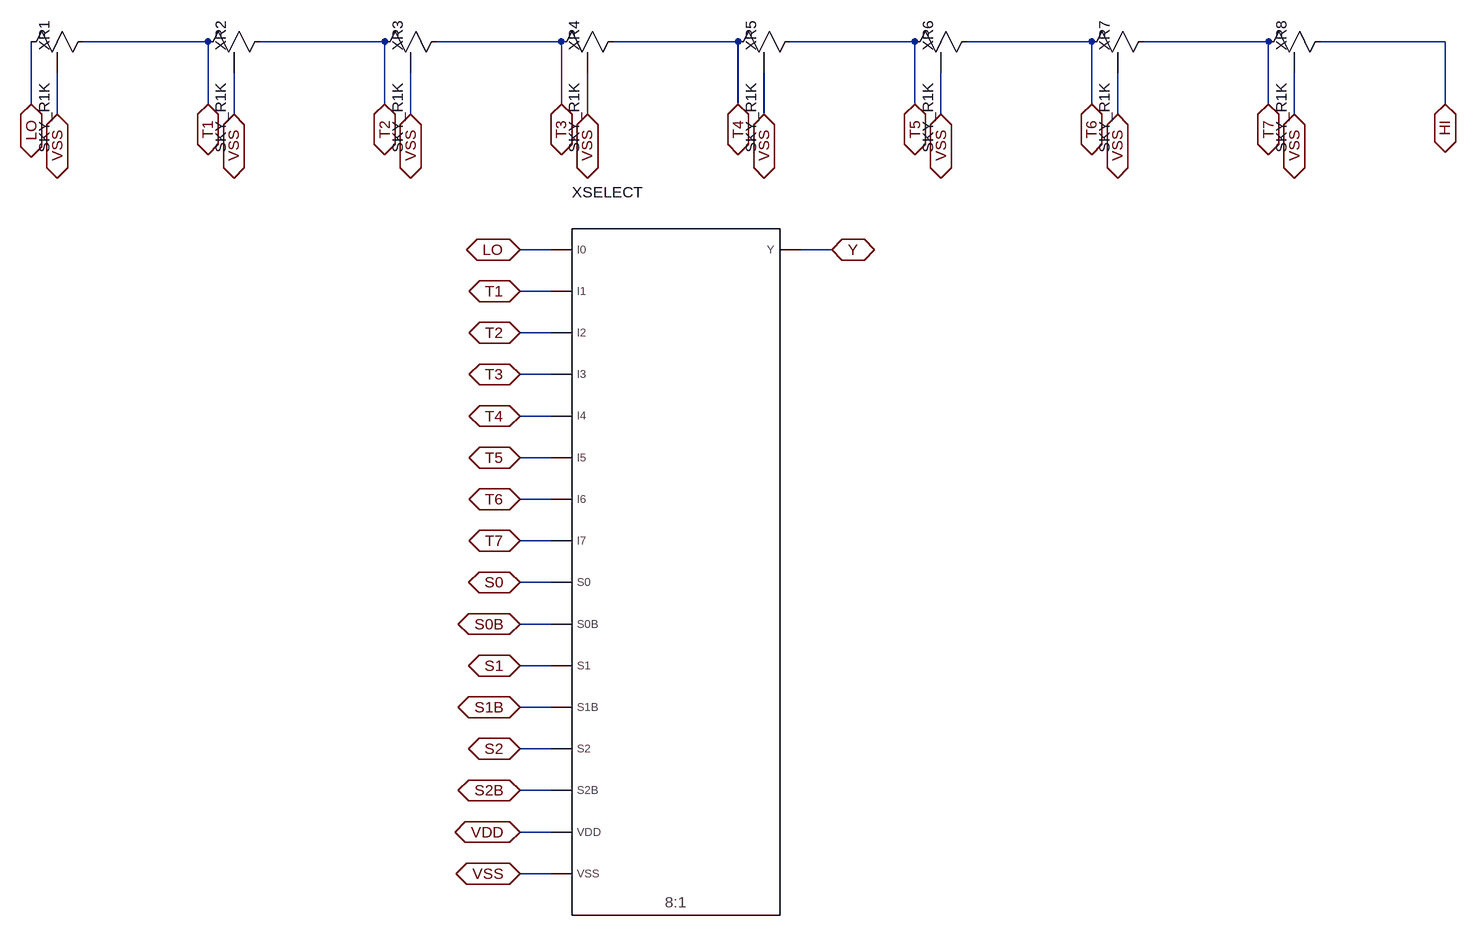
[diagram p0: schematic DAC_Bank8.asc]
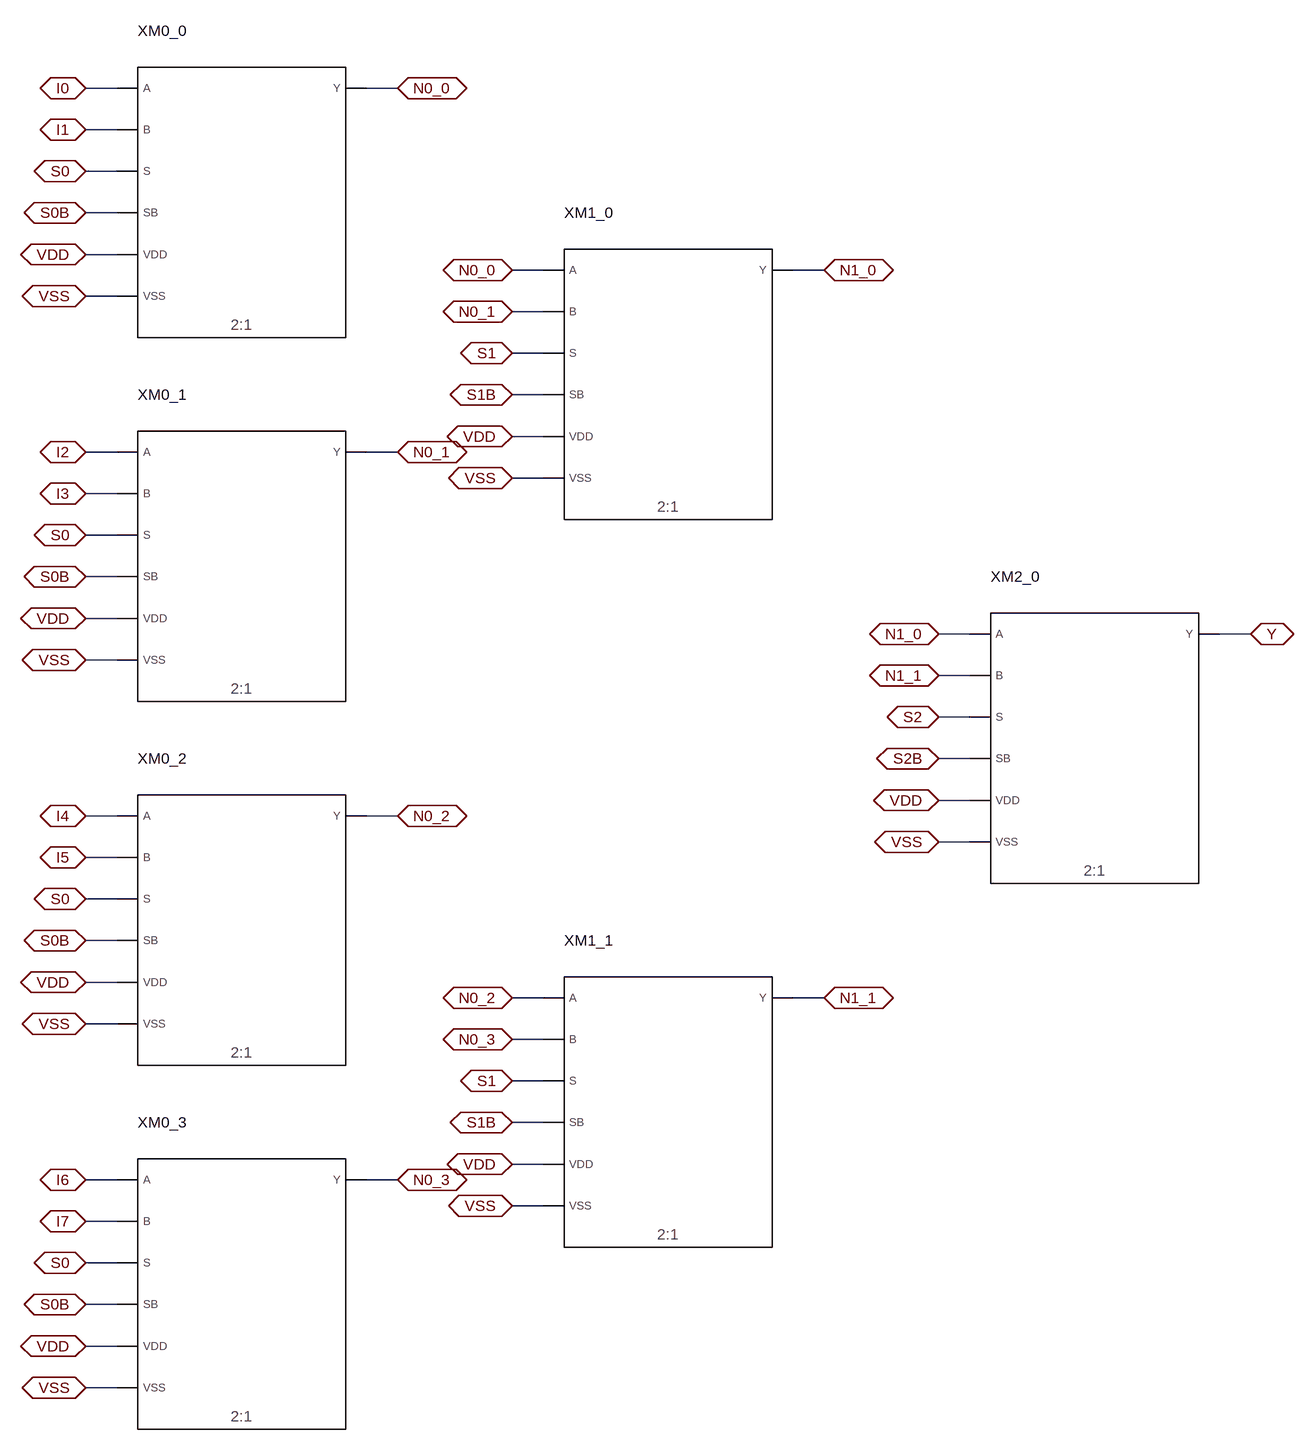
[diagram p1: sub-circuit dac_mux8.asc]
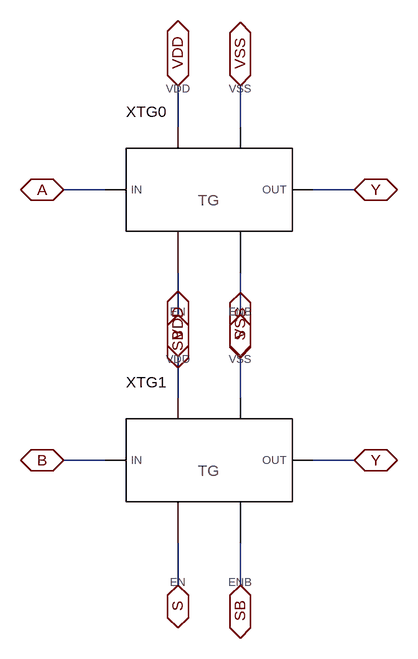
[diagram p2: sub-circuit dac_mux2.asc]
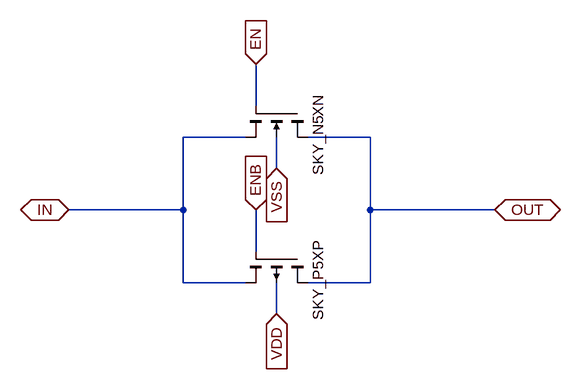
[diagram p3: sub-circuit cmos_tg.asc]
DAC_Bank8.asc, the LTspice schematic file:
Version 4.1
SHEET 1 2512 1664
WIRE 160 224 160 320
WIRE 240 224 432 224
WIRE 432 224 432 320
WIRE 512 224 704 224
WIRE 704 224 704 320
WIRE 784 224 976 224
WIRE 976 224 976 320
WIRE 1056 224 1248 224
WIRE 1248 224 1248 320
WIRE 1328 224 1520 224
WIRE 1520 224 1520 320
WIRE 1600 224 1792 224
WIRE 1792 224 1792 320
WIRE 1872 224 2064 224
WIRE 2064 224 2064 320
WIRE 2144 224 2336 224
WIRE 2336 224 2336 320
WIRE 960 544 912 544
WIRE 960 608 912 608
WIRE 960 672 912 672
WIRE 960 736 912 736
WIRE 960 800 912 800
WIRE 960 864 912 864
WIRE 960 928 912 928
WIRE 960 992 912 992
WIRE 960 1056 912 1056
WIRE 960 1120 912 1120
WIRE 960 1184 912 1184
WIRE 960 1248 912 1248
WIRE 960 1312 912 1312
WIRE 960 1376 912 1376
WIRE 960 1440 912 1440
WIRE 960 1504 912 1504
WIRE 1344 544 1392 544
WIRE 200 272 200 336
WIRE 472 272 472 336
WIRE 744 272 744 336
WIRE 1016 272 1016 336
WIRE 1288 272 1288 336
WIRE 1560 272 1560 336
WIRE 1832 272 1832 336
WIRE 2104 272 2104 336
FLAG 160 320 LO
IOPIN 160 320 BiDir
FLAG 432 320 T1
IOPIN 432 320 BiDir
FLAG 704 320 T2
IOPIN 704 320 BiDir
FLAG 976 320 T3
IOPIN 976 320 BiDir
FLAG 1248 320 T4
IOPIN 1248 320 BiDir
FLAG 1520 320 T5
IOPIN 1520 320 BiDir
FLAG 1792 320 T6
IOPIN 1792 320 BiDir
FLAG 2064 320 T7
IOPIN 2064 320 BiDir
FLAG 2336 320 HI
IOPIN 2336 320 BiDir
FLAG 912 544 LO
IOPIN 912 544 BiDir
FLAG 912 608 T1
IOPIN 912 608 BiDir
FLAG 912 672 T2
IOPIN 912 672 BiDir
FLAG 912 736 T3
IOPIN 912 736 BiDir
FLAG 912 800 T4
IOPIN 912 800 BiDir
FLAG 912 864 T5
IOPIN 912 864 BiDir
FLAG 912 928 T6
IOPIN 912 928 BiDir
FLAG 912 992 T7
IOPIN 912 992 BiDir
FLAG 912 1056 S0
IOPIN 912 1056 BiDir
FLAG 912 1120 S0B
IOPIN 912 1120 BiDir
FLAG 912 1184 S1
IOPIN 912 1184 BiDir
FLAG 912 1248 S1B
IOPIN 912 1248 BiDir
FLAG 912 1312 S2
IOPIN 912 1312 BiDir
FLAG 912 1376 S2B
IOPIN 912 1376 BiDir
FLAG 912 1440 VDD
IOPIN 912 1440 BiDir
FLAG 912 1504 VSS
IOPIN 912 1504 BiDir
FLAG 1392 544 Y
IOPIN 1392 544 BiDir
FLAG 200 336 VSS
IOPIN 200 336 BiDir
FLAG 472 336 VSS
IOPIN 472 336 BiDir
FLAG 744 336 VSS
IOPIN 744 336 BiDir
FLAG 1016 336 VSS
IOPIN 1016 336 BiDir
FLAG 1288 336 VSS
IOPIN 1288 336 BiDir
FLAG 1560 336 VSS
IOPIN 1560 336 BiDir
FLAG 1832 336 VSS
IOPIN 1832 336 BiDir
FLAG 2104 336 VSS
IOPIN 2104 336 BiDir
SYMBOL blocks\\Sky_R 256 208 R90
WINDOW 0 -16 76 Left 2
WINDOW 3 80 76 Left 2
SYMATTR InstName XR1
SYMATTR Value SKY_R1K
SYMATTR Prefix X
SYMBOL blocks\\Sky_R 528 208 R90
WINDOW 0 -16 76 Left 2
WINDOW 3 80 76 Left 2
SYMATTR InstName XR2
SYMATTR Value SKY_R1K
SYMATTR Prefix X
SYMBOL blocks\\Sky_R 800 208 R90
WINDOW 0 -16 76 Left 2
WINDOW 3 80 76 Left 2
SYMATTR InstName XR3
SYMATTR Value SKY_R1K
SYMATTR Prefix X
SYMBOL blocks\\Sky_R 1072 208 R90
WINDOW 0 -16 76 Left 2
WINDOW 3 80 76 Left 2
SYMATTR InstName XR4
SYMATTR Value SKY_R1K
SYMATTR Prefix X
SYMBOL blocks\\Sky_R 1344 208 R90
WINDOW 0 -16 76 Left 2
WINDOW 3 80 76 Left 2
SYMATTR InstName XR5
SYMATTR Value SKY_R1K
SYMATTR Prefix X
SYMBOL blocks\\Sky_R 1616 208 R90
WINDOW 0 -16 76 Left 2
WINDOW 3 80 76 Left 2
SYMATTR InstName XR6
SYMATTR Value SKY_R1K
SYMATTR Prefix X
SYMBOL blocks\\Sky_R 1888 208 R90
WINDOW 0 -16 76 Left 2
WINDOW 3 80 76 Left 2
SYMATTR InstName XR7
SYMATTR Value SKY_R1K
SYMATTR Prefix X
SYMBOL blocks\\Sky_R 2160 208 R90
WINDOW 0 -16 76 Left 2
WINDOW 3 80 76 Left 2
SYMATTR InstName XR8
SYMATTR Value SKY_R1K
SYMATTR Prefix X
SYMBOL blocks\\DAC_Mux8 960 480 R0
WINDOW 0 32 -24 Left 2
SYMATTR InstName XSELECT

dac_mux8.asc, the sub-circuit schematic file:
Version 4.1
SHEET 1 2112 2448
WIRE 192 160 144 160
WIRE 192 224 144 224
WIRE 192 288 144 288
WIRE 192 352 144 352
WIRE 192 416 144 416
WIRE 192 480 144 480
WIRE 576 160 624 160
WIRE 192 720 144 720
WIRE 192 784 144 784
WIRE 192 848 144 848
WIRE 192 912 144 912
WIRE 192 976 144 976
WIRE 192 1040 144 1040
WIRE 576 720 624 720
WIRE 192 1280 144 1280
WIRE 192 1344 144 1344
WIRE 192 1408 144 1408
WIRE 192 1472 144 1472
WIRE 192 1536 144 1536
WIRE 192 1600 144 1600
WIRE 576 1280 624 1280
WIRE 192 1840 144 1840
WIRE 192 1904 144 1904
WIRE 192 1968 144 1968
WIRE 192 2032 144 2032
WIRE 192 2096 144 2096
WIRE 192 2160 144 2160
WIRE 576 1840 624 1840
WIRE 848 440 800 440
WIRE 848 504 800 504
WIRE 848 568 800 568
WIRE 848 632 800 632
WIRE 848 696 800 696
WIRE 848 760 800 760
WIRE 1232 440 1280 440
WIRE 848 1560 800 1560
WIRE 848 1624 800 1624
WIRE 848 1688 800 1688
WIRE 848 1752 800 1752
WIRE 848 1816 800 1816
WIRE 848 1880 800 1880
WIRE 1232 1560 1280 1560
WIRE 1504 1000 1456 1000
WIRE 1504 1064 1456 1064
WIRE 1504 1128 1456 1128
WIRE 1504 1192 1456 1192
WIRE 1504 1256 1456 1256
WIRE 1504 1320 1456 1320
WIRE 1888 1000 1936 1000
FLAG 144 160 I0
IOPIN 144 160 BiDir
FLAG 144 224 I1
IOPIN 144 224 BiDir
FLAG 144 288 S0
IOPIN 144 288 BiDir
FLAG 144 352 S0B
IOPIN 144 352 BiDir
FLAG 144 416 VDD
IOPIN 144 416 BiDir
FLAG 144 480 VSS
IOPIN 144 480 BiDir
FLAG 624 160 N0_0
IOPIN 624 160 BiDir
FLAG 144 720 I2
IOPIN 144 720 BiDir
FLAG 144 784 I3
IOPIN 144 784 BiDir
FLAG 144 848 S0
IOPIN 144 848 BiDir
FLAG 144 912 S0B
IOPIN 144 912 BiDir
FLAG 144 976 VDD
IOPIN 144 976 BiDir
FLAG 144 1040 VSS
IOPIN 144 1040 BiDir
FLAG 624 720 N0_1
IOPIN 624 720 BiDir
FLAG 144 1280 I4
IOPIN 144 1280 BiDir
FLAG 144 1344 I5
IOPIN 144 1344 BiDir
FLAG 144 1408 S0
IOPIN 144 1408 BiDir
FLAG 144 1472 S0B
IOPIN 144 1472 BiDir
FLAG 144 1536 VDD
IOPIN 144 1536 BiDir
FLAG 144 1600 VSS
IOPIN 144 1600 BiDir
FLAG 624 1280 N0_2
IOPIN 624 1280 BiDir
FLAG 144 1840 I6
IOPIN 144 1840 BiDir
FLAG 144 1904 I7
IOPIN 144 1904 BiDir
FLAG 144 1968 S0
IOPIN 144 1968 BiDir
FLAG 144 2032 S0B
IOPIN 144 2032 BiDir
FLAG 144 2096 VDD
IOPIN 144 2096 BiDir
FLAG 144 2160 VSS
IOPIN 144 2160 BiDir
FLAG 624 1840 N0_3
IOPIN 624 1840 BiDir
FLAG 800 440 N0_0
IOPIN 800 440 BiDir
FLAG 800 504 N0_1
IOPIN 800 504 BiDir
FLAG 800 568 S1
IOPIN 800 568 BiDir
FLAG 800 632 S1B
IOPIN 800 632 BiDir
FLAG 800 696 VDD
IOPIN 800 696 BiDir
FLAG 800 760 VSS
IOPIN 800 760 BiDir
FLAG 1280 440 N1_0
IOPIN 1280 440 BiDir
FLAG 800 1560 N0_2
IOPIN 800 1560 BiDir
FLAG 800 1624 N0_3
IOPIN 800 1624 BiDir
FLAG 800 1688 S1
IOPIN 800 1688 BiDir
FLAG 800 1752 S1B
IOPIN 800 1752 BiDir
FLAG 800 1816 VDD
IOPIN 800 1816 BiDir
FLAG 800 1880 VSS
IOPIN 800 1880 BiDir
FLAG 1280 1560 N1_1
IOPIN 1280 1560 BiDir
FLAG 1456 1000 N1_0
IOPIN 1456 1000 BiDir
FLAG 1456 1064 N1_1
IOPIN 1456 1064 BiDir
FLAG 1456 1128 S2
IOPIN 1456 1128 BiDir
FLAG 1456 1192 S2B
IOPIN 1456 1192 BiDir
FLAG 1456 1256 VDD
IOPIN 1456 1256 BiDir
FLAG 1456 1320 VSS
IOPIN 1456 1320 BiDir
FLAG 1936 1000 Y
IOPIN 1936 1000 BiDir
SYMBOL blocks\\DAC_Mux2 192 96 R0
WINDOW 0 32 -24 Left 2
SYMATTR InstName XM0_0
SYMBOL blocks\\DAC_Mux2 192 656 R0
WINDOW 0 32 -24 Left 2
SYMATTR InstName XM0_1
SYMBOL blocks\\DAC_Mux2 192 1216 R0
WINDOW 0 32 -24 Left 2
SYMATTR InstName XM0_2
SYMBOL blocks\\DAC_Mux2 192 1776 R0
WINDOW 0 32 -24 Left 2
SYMATTR InstName XM0_3
SYMBOL blocks\\DAC_Mux2 848 376 R0
WINDOW 0 32 -24 Left 2
SYMATTR InstName XM1_0
SYMBOL blocks\\DAC_Mux2 848 1496 R0
WINDOW 0 32 -24 Left 2
SYMATTR InstName XM1_1
SYMBOL blocks\\DAC_Mux2 1504 936 R0
WINDOW 0 32 -24 Left 2
SYMATTR InstName XM2_0

dac_mux2.asc, the sub-circuit schematic file:
Version 4.1
SHEET 1 1344 1008
WIRE 352 224 288 224
WIRE 672 224 736 224
WIRE 464 128 464 64
WIRE 560 128 560 64
WIRE 464 352 464 416
WIRE 560 352 560 416
WIRE 352 640 288 640
WIRE 672 640 736 640
WIRE 464 544 464 480
WIRE 560 544 560 480
WIRE 464 768 464 832
WIRE 560 768 560 832
FLAG 288 224 A
IOPIN 288 224 BiDir
FLAG 736 224 Y
IOPIN 736 224 BiDir
FLAG 464 64 VDD
IOPIN 464 64 BiDir
FLAG 560 64 VSS
IOPIN 560 64 BiDir
FLAG 464 416 SB
IOPIN 464 416 BiDir
FLAG 560 416 S
IOPIN 560 416 BiDir
FLAG 288 640 B
IOPIN 288 640 BiDir
FLAG 736 640 Y
IOPIN 736 640 BiDir
FLAG 464 480 VDD
IOPIN 464 480 BiDir
FLAG 560 480 VSS
IOPIN 560 480 BiDir
FLAG 464 832 S
IOPIN 464 832 BiDir
FLAG 560 832 SB
IOPIN 560 832 BiDir
SYMBOL blocks\\CMOS_TG 352 128 R0
WINDOW 0 32 -24 Left 2
SYMATTR InstName XTG0
SYMBOL blocks\\CMOS_TG 352 544 R0
WINDOW 0 32 -24 Left 2
SYMATTR InstName XTG1

cmos_tg.asc, the sub-circuit schematic file:
Version 4.1
SHEET 1 960 704
WIRE 304 192 400 192
WIRE 496 192 592 192
WIRE 416 144 416 80
WIRE 448 192 448 240
WIRE 304 416 400 416
WIRE 496 416 592 416
WIRE 416 368 416 304
WIRE 448 416 448 464
WIRE 304 192 304 304
WIRE 304 304 304 416
WIRE 128 304 304 304
WIRE 592 192 592 304
WIRE 592 304 592 416
WIRE 592 304 784 304
FLAG 416 80 EN
IOPIN 416 80 In
FLAG 448 240 VSS
IOPIN 448 240 In
FLAG 416 304 ENB
IOPIN 416 304 In
FLAG 448 464 VDD
IOPIN 448 464 In
FLAG 128 304 IN
IOPIN 128 304 BiDir
FLAG 784 304 OUT
IOPIN 784 304 BiDir
SYMBOL nmos4 496 144 R90
WINDOW 0 -16 -16 Left 2
WINDOW 3 16 -16 Left 2
SYMATTR InstName XN
SYMATTR Value SKY_N5
SYMATTR SpiceLine w=7 l=0.5 mult=4
SYMATTR Prefix X
SYMBOL pmos4 496 368 R90
WINDOW 0 -16 -16 Left 2
WINDOW 3 16 -16 Left 2
SYMATTR InstName XP
SYMATTR Value SKY_P5
SYMATTR SpiceLine w=7 l=0.5 mult=8
SYMATTR Prefix X

The netlist it stands for:
* DAC_Bank8.asc
X§XR1 T1 LO VSS SKY_R1K  ; pins A B SUB
X§XR2 T2 T1 VSS SKY_R1K  ; pins A B SUB
X§XR3 T3 T2 VSS SKY_R1K  ; pins A B SUB
X§XR4 T4 T3 VSS SKY_R1K  ; pins A B SUB
X§XR5 T5 T4 VSS SKY_R1K  ; pins A B SUB
X§XR6 T6 T5 VSS SKY_R1K  ; pins A B SUB
X§XR7 T7 T6 VSS SKY_R1K  ; pins A B SUB
X§XR8 HI T7 VSS SKY_R1K  ; pins A B SUB
X§XSELECT LO T1 T2 T3 T4 T5 T6 T7 S0 S0B S1 S1B S2 S2B VDD VSS Y dac_mux8

* block symbol definitions
.subckt dac_mux8 I0 I1 I2 I3 I4 I5 I6 I7 S0 S0B S1 S1B S2 S2B VDD VSS Y
X§XM0_0 I0 I1 S0 S0B VDD VSS N0_0 dac_mux2
X§XM0_1 I2 I3 S0 S0B VDD VSS N0_1 dac_mux2
X§XM0_2 I4 I5 S0 S0B VDD VSS N0_2 dac_mux2
X§XM0_3 I6 I7 S0 S0B VDD VSS N0_3 dac_mux2
X§XM1_0 N0_0 N0_1 S1 S1B VDD VSS N1_0 dac_mux2
X§XM1_1 N0_2 N0_3 S1 S1B VDD VSS N1_1 dac_mux2
X§XM2_0 N1_0 N1_1 S2 S2B VDD VSS Y dac_mux2
.ends dac_mux8

.subckt dac_mux2 A B S SB VDD VSS Y
X§XTG0 A Y SB S VDD VSS cmos_tg
X§XTG1 B Y S SB VDD VSS cmos_tg
.ends dac_mux2

.subckt cmos_tg IN OUT EN ENB VDD VSS
X§XN OUT EN IN VSS SKY_N5 w=7 l=0.5 mult=4  ; pins D G S B
X§XP OUT ENB IN VDD SKY_P5 w=7 l=0.5 mult=8  ; pins D G S B
.ends cmos_tg

.backanno
.end